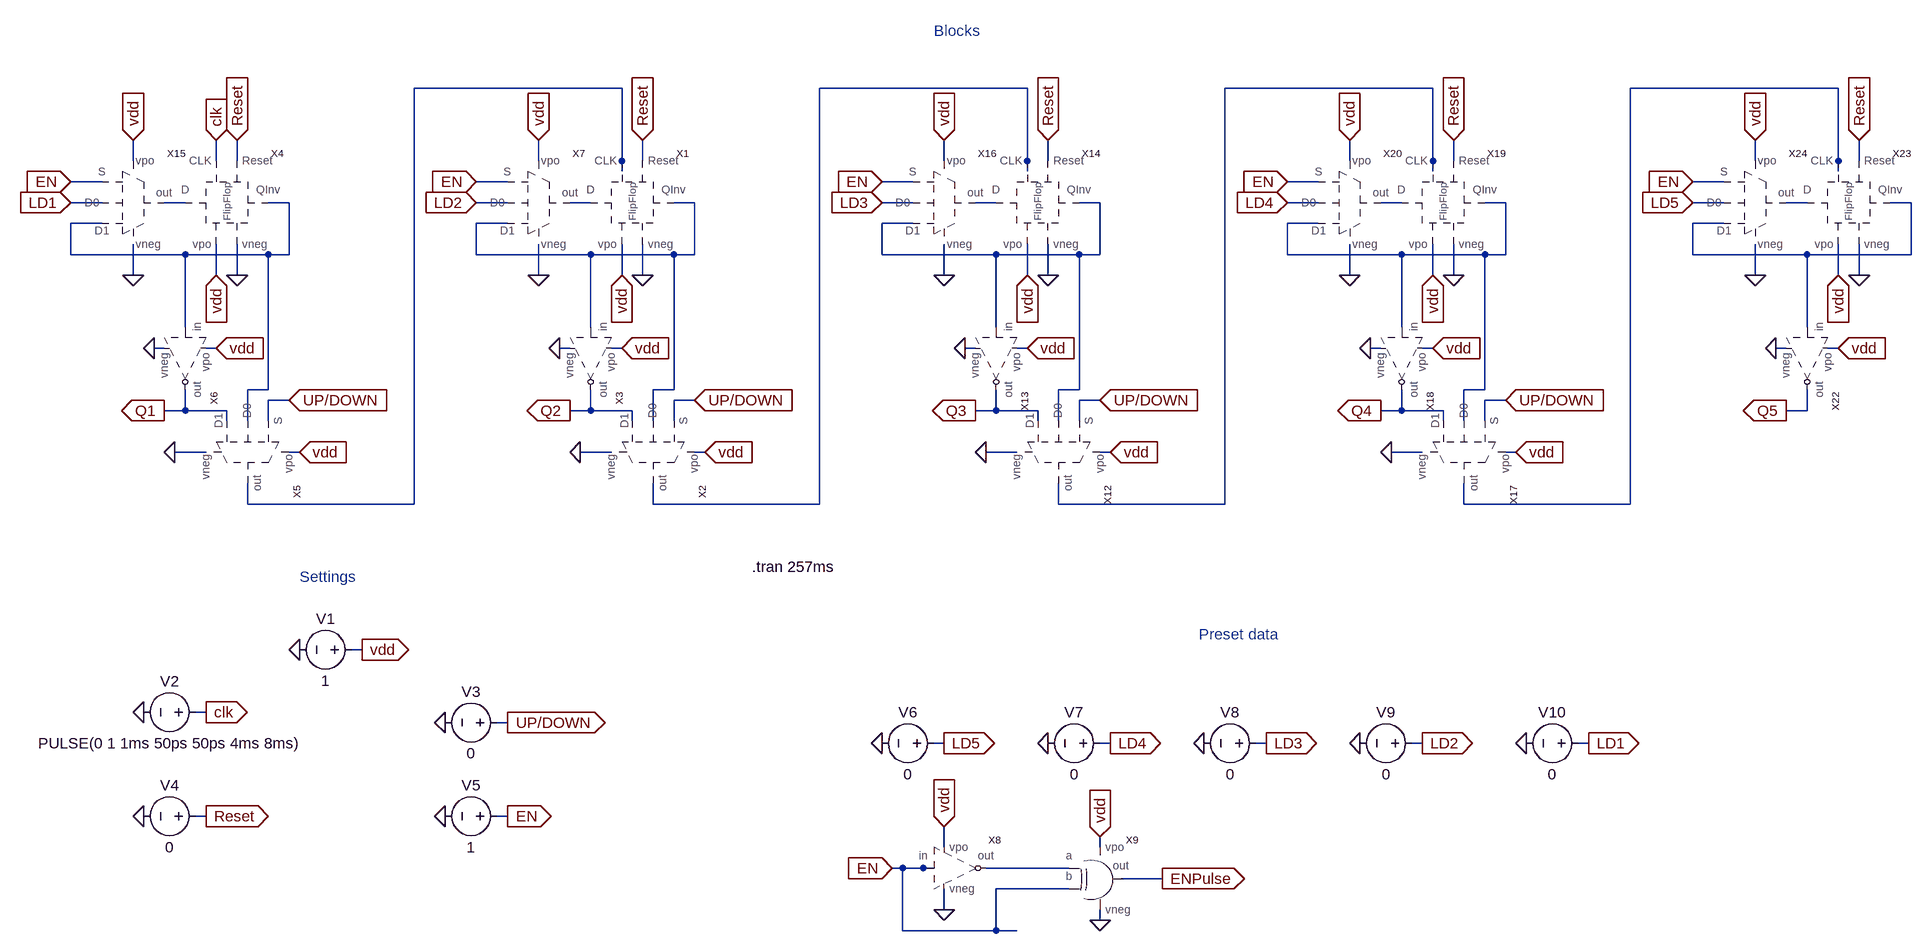
[diagram p0: schematic 5 Bit counter.asc]
5 Bit counter.asc, the LTspice schematic file:
Version 4
SHEET 1 3884 3028
WIRE 1728 48 1408 48
WIRE 2352 48 2032 48
WIRE 2976 48 2656 48
WIRE 3600 48 3280 48
WIRE 976 160 976 128
WIRE 1104 160 1104 128
WIRE 1136 160 1136 128
WIRE 1600 160 1600 128
WIRE 1728 160 1728 48
WIRE 1760 160 1760 128
WIRE 2224 160 2224 128
WIRE 2352 160 2352 48
WIRE 2384 160 2384 128
WIRE 2848 160 2848 128
WIRE 2976 160 2976 48
WIRE 3008 160 3008 128
WIRE 3472 160 3472 128
WIRE 3600 160 3600 48
WIRE 3632 160 3632 128
WIRE 1728 176 1728 160
WIRE 2352 176 2352 160
WIRE 2976 176 2976 160
WIRE 3600 176 3600 160
WIRE 928 192 880 192
WIRE 1552 192 1504 192
WIRE 2176 192 2128 192
WIRE 2800 192 2752 192
WIRE 3424 192 3376 192
WIRE 928 224 880 224
WIRE 1056 224 1024 224
WIRE 1216 224 1184 224
WIRE 1552 224 1504 224
WIRE 1680 224 1648 224
WIRE 1840 224 1808 224
WIRE 2176 224 2128 224
WIRE 2304 224 2272 224
WIRE 2464 224 2432 224
WIRE 2800 224 2752 224
WIRE 2928 224 2896 224
WIRE 3088 224 3056 224
WIRE 3424 224 3376 224
WIRE 3552 224 3520 224
WIRE 3712 224 3680 224
WIRE 928 256 880 256
WIRE 1552 256 1504 256
WIRE 2176 256 2128 256
WIRE 2800 256 2752 256
WIRE 3424 256 3376 256
WIRE 880 304 880 256
WIRE 1056 304 880 304
WIRE 1184 304 1056 304
WIRE 1216 304 1216 224
WIRE 1216 304 1184 304
WIRE 1504 304 1504 256
WIRE 1680 304 1504 304
WIRE 1808 304 1680 304
WIRE 1840 304 1840 224
WIRE 1840 304 1808 304
WIRE 2128 304 2128 256
WIRE 2304 304 2128 304
WIRE 2432 304 2304 304
WIRE 2464 304 2464 224
WIRE 2464 304 2432 304
WIRE 2752 304 2752 256
WIRE 2928 304 2752 304
WIRE 3056 304 2928 304
WIRE 3088 304 3088 224
WIRE 3088 304 3056 304
WIRE 3376 304 3376 256
WIRE 3552 304 3376 304
WIRE 3712 304 3712 224
WIRE 3712 304 3552 304
WIRE 976 336 976 288
WIRE 1104 336 1104 288
WIRE 1136 336 1136 288
WIRE 1600 336 1600 288
WIRE 1728 336 1728 288
WIRE 1760 336 1760 288
WIRE 2224 336 2224 288
WIRE 2352 336 2352 288
WIRE 2384 336 2384 288
WIRE 2848 336 2848 288
WIRE 2976 336 2976 288
WIRE 3008 336 3008 288
WIRE 3472 336 3472 288
WIRE 3600 336 3600 288
WIRE 3632 336 3632 288
WIRE 1056 416 1056 304
WIRE 1680 416 1680 304
WIRE 2304 416 2304 304
WIRE 2928 416 2928 304
WIRE 3552 416 3552 304
WIRE 1024 448 1008 448
WIRE 1104 448 1088 448
WIRE 1648 448 1632 448
WIRE 1728 448 1712 448
WIRE 2272 448 2256 448
WIRE 2352 448 2336 448
WIRE 2896 448 2880 448
WIRE 2976 448 2960 448
WIRE 3520 448 3504 448
WIRE 3600 448 3584 448
WIRE 1184 512 1184 304
WIRE 1184 512 1152 512
WIRE 1808 512 1808 304
WIRE 1808 512 1776 512
WIRE 2432 512 2432 304
WIRE 2432 512 2400 512
WIRE 3056 512 3056 304
WIRE 3056 512 3024 512
WIRE 1216 528 1184 528
WIRE 1840 528 1808 528
WIRE 2464 528 2432 528
WIRE 3088 528 3056 528
WIRE 1056 544 1056 512
WIRE 1056 544 1024 544
WIRE 1120 544 1056 544
WIRE 1680 544 1680 512
WIRE 1680 544 1648 544
WIRE 1744 544 1680 544
WIRE 2304 544 2304 512
WIRE 2304 544 2272 544
WIRE 2368 544 2304 544
WIRE 2928 544 2928 512
WIRE 2928 544 2896 544
WIRE 2992 544 2928 544
WIRE 3552 544 3552 512
WIRE 3552 544 3520 544
WIRE 1120 560 1120 544
WIRE 1152 560 1152 512
WIRE 1184 560 1184 528
WIRE 1744 560 1744 544
WIRE 1776 560 1776 512
WIRE 1808 560 1808 528
WIRE 2368 560 2368 544
WIRE 2400 560 2400 512
WIRE 2432 560 2432 528
WIRE 2992 560 2992 544
WIRE 3024 560 3024 512
WIRE 3056 560 3056 528
WIRE 1088 608 1040 608
WIRE 1232 608 1216 608
WIRE 1712 608 1664 608
WIRE 1856 608 1840 608
WIRE 2336 608 2288 608
WIRE 2480 608 2464 608
WIRE 2960 608 2912 608
WIRE 3104 608 3088 608
WIRE 1152 688 1152 656
WIRE 1408 688 1408 48
WIRE 1408 688 1152 688
WIRE 1776 688 1776 656
WIRE 2032 688 2032 48
WIRE 2032 688 1776 688
WIRE 2400 688 2400 656
WIRE 2656 688 2656 48
WIRE 2656 688 2400 688
WIRE 3024 688 3024 656
WIRE 3280 688 3280 48
WIRE 3280 688 3024 688
WIRE 1328 912 1312 912
WIRE 1088 1008 1072 1008
WIRE 1552 1024 1536 1024
WIRE 2224 1056 2208 1056
WIRE 2480 1056 2464 1056
WIRE 2720 1056 2704 1056
WIRE 2960 1056 2944 1056
WIRE 3216 1056 3200 1056
WIRE 1088 1168 1072 1168
WIRE 1552 1168 1536 1168
WIRE 2224 1216 2224 1184
WIRE 2464 1216 2464 1200
WIRE 2160 1248 2144 1248
WIRE 2192 1248 2160 1248
WIRE 2208 1248 2192 1248
WIRE 2416 1248 2288 1248
WIRE 2560 1264 2496 1264
WIRE 2416 1280 2304 1280
WIRE 2224 1312 2224 1280
WIRE 2464 1328 2464 1312
WIRE 2160 1344 2160 1248
WIRE 2304 1344 2304 1280
WIRE 2304 1344 2160 1344
WIRE 2336 1344 2304 1344
FLAG 1328 912 vdd
IOPIN 1328 912 Out
FLAG 992 1008 0
FLAG 1088 1008 clk
IOPIN 1088 1008 Out
FLAG 1456 1024 0
FLAG 1232 912 0
FLAG 1552 1024 UP/DOWN
IOPIN 1552 1024 Out
FLAG 1136 128 Reset
IOPIN 1136 128 In
FLAG 1216 528 UP/DOWN
IOPIN 1216 528 In
FLAG 1008 448 0
FLAG 1104 448 vdd
IOPIN 1104 448 In
FLAG 1040 608 0
FLAG 1232 608 vdd
IOPIN 1232 608 In
FLAG 1104 336 vdd
IOPIN 1104 336 In
FLAG 1136 336 0
FLAG 1104 128 clk
IOPIN 1104 128 In
FLAG 1088 1168 Reset
IOPIN 1088 1168 Out
FLAG 992 1168 0
FLAG 1024 544 Q1
IOPIN 1024 544 Out
FLAG 1840 528 UP/DOWN
IOPIN 1840 528 In
FLAG 1632 448 0
FLAG 1728 448 vdd
IOPIN 1728 448 In
FLAG 1664 608 0
FLAG 1856 608 vdd
IOPIN 1856 608 In
FLAG 1648 544 Q2
IOPIN 1648 544 Out
FLAG 976 336 0
FLAG 880 224 LD1
IOPIN 880 224 In
FLAG 976 128 vdd
IOPIN 976 128 In
FLAG 880 192 EN
IOPIN 880 192 In
FLAG 1760 128 Reset
IOPIN 1760 128 In
FLAG 1728 336 vdd
IOPIN 1728 336 In
FLAG 1760 336 0
FLAG 1600 336 0
FLAG 1504 224 LD2
IOPIN 1504 224 In
FLAG 1600 128 vdd
IOPIN 1600 128 In
FLAG 1504 192 EN
IOPIN 1504 192 In
FLAG 2464 528 UP/DOWN
IOPIN 2464 528 In
FLAG 2256 448 0
FLAG 2352 448 vdd
IOPIN 2352 448 In
FLAG 2288 608 0
FLAG 2480 608 vdd
IOPIN 2480 608 In
FLAG 2272 544 Q3
IOPIN 2272 544 Out
FLAG 2384 128 Reset
IOPIN 2384 128 In
FLAG 2352 336 vdd
IOPIN 2352 336 In
FLAG 2384 336 0
FLAG 2224 336 0
FLAG 2128 224 LD3
IOPIN 2128 224 In
FLAG 2224 128 vdd
IOPIN 2224 128 In
FLAG 2128 192 EN
IOPIN 2128 192 In
FLAG 3088 528 UP/DOWN
IOPIN 3088 528 In
FLAG 2880 448 0
FLAG 2976 448 vdd
IOPIN 2976 448 In
FLAG 2912 608 0
FLAG 3104 608 vdd
IOPIN 3104 608 In
FLAG 2896 544 Q4
IOPIN 2896 544 Out
FLAG 3008 128 Reset
IOPIN 3008 128 In
FLAG 2976 336 vdd
IOPIN 2976 336 In
FLAG 3008 336 0
FLAG 2848 336 0
FLAG 2752 224 LD4
IOPIN 2752 224 In
FLAG 2848 128 vdd
IOPIN 2848 128 In
FLAG 2752 192 EN
IOPIN 2752 192 In
FLAG 3504 448 0
FLAG 3600 448 vdd
IOPIN 3600 448 In
FLAG 3520 544 Q5
IOPIN 3520 544 Out
FLAG 3632 128 Reset
IOPIN 3632 128 In
FLAG 3600 336 vdd
IOPIN 3600 336 In
FLAG 3632 336 0
FLAG 3472 336 0
FLAG 3376 224 LD5
IOPIN 3376 224 In
FLAG 3472 128 vdd
IOPIN 3472 128 In
FLAG 3376 192 EN
IOPIN 3376 192 In
FLAG 1552 1168 EN
IOPIN 1552 1168 Out
FLAG 1456 1168 0
FLAG 2224 1056 LD5
IOPIN 2224 1056 Out
FLAG 2128 1056 0
FLAG 2480 1056 LD4
IOPIN 2480 1056 Out
FLAG 2384 1056 0
FLAG 2720 1056 LD3
IOPIN 2720 1056 Out
FLAG 2624 1056 0
FLAG 2960 1056 LD2
IOPIN 2960 1056 Out
FLAG 2864 1056 0
FLAG 3216 1056 LD1
IOPIN 3216 1056 Out
FLAG 3120 1056 0
FLAG 2224 1312 0
FLAG 2224 1184 vdd
IOPIN 2224 1184 In
FLAG 2144 1248 EN
IOPIN 2144 1248 In
FLAG 2464 1200 vdd
IOPIN 2464 1200 In
FLAG 2464 1328 0
FLAG 2560 1264 ENPulse
IOPIN 2560 1264 Out
SYMBOL Voltage 1088 1008 R90
WINDOW 0 -32 56 VBottom 2
WINDOW 3 32 56 VTop 2
SYMATTR InstName V2
SYMATTR Value PULSE(0 1 1ms 50ps 50ps 4ms 8ms)
SYMBOL Voltage 1328 912 R90
WINDOW 0 -32 56 VBottom 2
WINDOW 3 32 56 VTop 2
SYMATTR InstName V1
SYMATTR Value 1
SYMBOL Voltage 1552 1024 R90
WINDOW 0 -32 56 VBottom 2
WINDOW 3 32 56 VTop 2
SYMATTR InstName V3
SYMATTR Value 0
SYMBOL DFlipFlop 1120 224 R0
SYMATTR InstName X4
SYMBOL Multiplexer 1152 608 R90
SYMATTR InstName X5
SYMBOL Inverter 1056 448 R90
SYMATTR InstName X6
SYMBOL Voltage 1088 1168 R90
WINDOW 0 -32 56 VBottom 2
WINDOW 3 32 56 VTop 2
SYMATTR InstName V4
SYMATTR Value 0
SYMBOL Multiplexer 1776 608 R90
SYMATTR InstName X2
SYMBOL Inverter 1680 448 R90
SYMATTR InstName X3
SYMBOL Multiplexer 976 224 R0
SYMATTR InstName X15
SYMBOL DFlipFlop 1744 224 R0
SYMATTR InstName X1
SYMBOL Multiplexer 1600 224 R0
SYMATTR InstName X7
SYMBOL Multiplexer 2400 608 R90
SYMATTR InstName X12
SYMBOL Inverter 2304 448 R90
SYMATTR InstName X13
SYMBOL DFlipFlop 2368 224 R0
SYMATTR InstName X14
SYMBOL Multiplexer 2224 224 R0
SYMATTR InstName X16
SYMBOL Multiplexer 3024 608 R90
SYMATTR InstName X17
SYMBOL Inverter 2928 448 R90
SYMATTR InstName X18
SYMBOL DFlipFlop 2992 224 R0
SYMATTR InstName X19
SYMBOL Multiplexer 2848 224 R0
SYMATTR InstName X20
SYMBOL Inverter 3552 448 R90
SYMATTR InstName X22
SYMBOL DFlipFlop 3616 224 R0
SYMATTR InstName X23
SYMBOL Multiplexer 3472 224 R0
SYMATTR InstName X24
SYMBOL Voltage 1552 1168 R90
WINDOW 0 -32 56 VBottom 2
WINDOW 3 32 56 VTop 2
SYMATTR InstName V5
SYMATTR Value 1
SYMBOL Voltage 2224 1056 R90
WINDOW 0 -32 56 VBottom 2
WINDOW 3 32 56 VTop 2
SYMATTR InstName V6
SYMATTR Value 0
SYMBOL Voltage 2480 1056 R90
WINDOW 0 -32 56 VBottom 2
WINDOW 3 32 56 VTop 2
SYMATTR InstName V7
SYMATTR Value 0
SYMBOL Voltage 2720 1056 R90
WINDOW 0 -32 56 VBottom 2
WINDOW 3 32 56 VTop 2
SYMATTR InstName V8
SYMATTR Value 0
SYMBOL Voltage 2960 1056 R90
WINDOW 0 -32 56 VBottom 2
WINDOW 3 32 56 VTop 2
SYMATTR InstName V9
SYMATTR Value 0
SYMBOL Voltage 3216 1056 R90
WINDOW 0 -32 56 VBottom 2
WINDOW 3 32 56 VTop 2
SYMATTR InstName V10
SYMATTR Value 0
SYMBOL Inverter 2224 1248 R0
SYMATTR InstName X8
SYMBOL XOR 2448 1264 R0
SYMATTR InstName X9
TEXT 1928 784 Left 2 !.tran 257ms
TEXT 2616 888 Left 2 ;Preset data
TEXT 1232 800 Left 2 ;Settings
TEXT 2208 -40 Left 2 ;Blocks

The netlist it stands for:
* 5 Bit counter.asc
V2 clk 0 PULSE(0 1 1ms 50ps 50ps 4ms 8ms)
V1 vdd 0 1
V3 UP/DOWN 0 0
XX4 clk N005 Reset N006 vdd 0 DFlipFlop  ; pins CLK D Reset QInv vpo vneg
XX5 vdd 0 Q1 N006 UP/DOWN N001 Multiplexer  ; pins vpo vneg D1 D0 S out
XX6 N006 Q1 vdd 0 Inverter  ; pins in out vpo vneg
V4 Reset 0 0
XX2 vdd 0 Q2 N008 UP/DOWN N002 Multiplexer  ; pins vpo vneg D1 D0 S out
XX3 N008 Q2 vdd 0 Inverter  ; pins in out vpo vneg
XX15 vdd 0 N006 LD1 EN N005 Multiplexer  ; pins vpo vneg D1 D0 S out
XX1 N001 N007 Reset N008 vdd 0 DFlipFlop  ; pins CLK D Reset QInv vpo vneg
XX7 vdd 0 N008 LD2 EN N007 Multiplexer  ; pins vpo vneg D1 D0 S out
XX12 vdd 0 Q3 N010 UP/DOWN N003 Multiplexer  ; pins vpo vneg D1 D0 S out
XX13 N010 Q3 vdd 0 Inverter  ; pins in out vpo vneg
XX14 N002 N009 Reset N010 vdd 0 DFlipFlop  ; pins CLK D Reset QInv vpo vneg
XX16 vdd 0 N010 LD3 EN N009 Multiplexer  ; pins vpo vneg D1 D0 S out
XX17 vdd 0 Q4 N012 UP/DOWN N004 Multiplexer  ; pins vpo vneg D1 D0 S out
XX18 N012 Q4 vdd 0 Inverter  ; pins in out vpo vneg
XX19 N003 N011 Reset N012 vdd 0 DFlipFlop  ; pins CLK D Reset QInv vpo vneg
XX20 vdd 0 N012 LD4 EN N011 Multiplexer  ; pins vpo vneg D1 D0 S out
XX22 N014 Q5 vdd 0 Inverter  ; pins in out vpo vneg
XX23 N004 N013 Reset N014 vdd 0 DFlipFlop  ; pins CLK D Reset QInv vpo vneg
XX24 vdd 0 N014 LD5 EN N013 Multiplexer  ; pins vpo vneg D1 D0 S out
V5 EN 0 1
V6 LD5 0 0
V7 LD4 0 0
V8 LD3 0 0
V9 LD2 0 0
V10 LD1 0 0
XX8 EN N015 vdd 0 Inverter  ; pins in out vpo vneg
XX9 ENPulse N015 EN 0 vdd XOR  ; pins out a b vneg vpo
.tran 257ms
* Preset data
* Settings
* Blocks
.backanno
.end